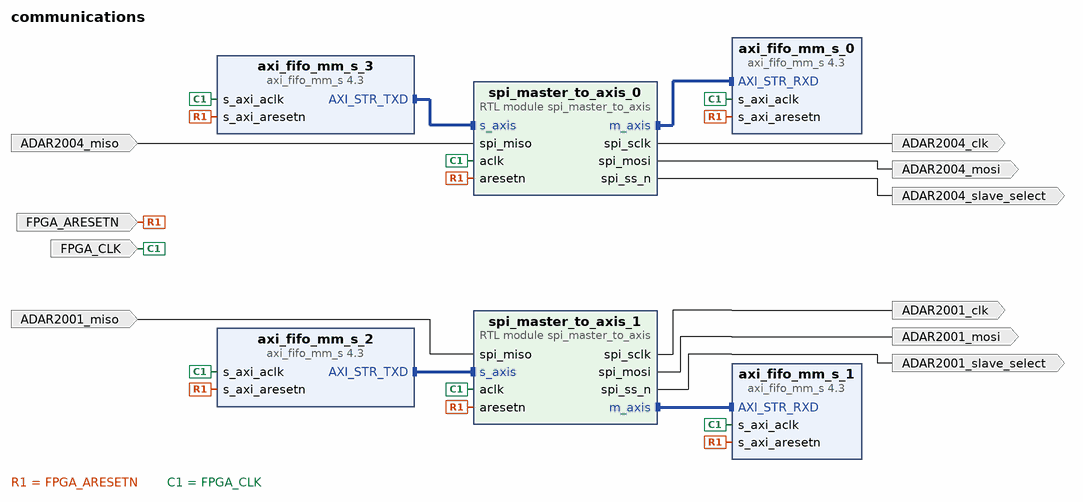
[diagram p0: block diagram of the top level]
# Vivado block design communications, xc7a35tcpg236-1, Vivado 2026.1
create_bd_design communications

create_bd_port -dir I -type clk FPGA_CLK
set_property -dict {CONFIG.FREQ_HZ 100000000} [get_bd_ports FPGA_CLK]
create_bd_port -dir I FPGA_ARESETN
create_bd_port -dir O ADAR2004_clk
create_bd_port -dir O ADAR2004_slave_select
create_bd_port -dir O ADAR2004_mosi
create_bd_port -dir I ADAR2004_miso
create_bd_port -dir O ADAR2001_clk
create_bd_port -dir I ADAR2001_miso
create_bd_port -dir O ADAR2001_mosi
create_bd_port -dir O ADAR2001_slave_select

create_bd_cell -type module -reference spi_master_to_axis spi_master_to_axis_0
create_bd_cell -type module -reference spi_master_to_axis spi_master_to_axis_1
create_bd_cell -type ip -vlnv xilinx.com:ip:axi_fifo_mm_s:4.3 axi_fifo_mm_s_0
create_bd_cell -type ip -vlnv xilinx.com:ip:axi_fifo_mm_s:4.3 axi_fifo_mm_s_1
create_bd_cell -type ip -vlnv xilinx.com:ip:axi_fifo_mm_s:4.3 axi_fifo_mm_s_2
create_bd_cell -type ip -vlnv xilinx.com:ip:axi_fifo_mm_s:4.3 axi_fifo_mm_s_3

# ---- connections ----

connect_bd_intf_net [get_bd_intf_pins axi_fifo_mm_s_2/AXI_STR_TXD] [get_bd_intf_pins spi_master_to_axis_1/s_axis]
connect_bd_intf_net [get_bd_intf_pins axi_fifo_mm_s_3/AXI_STR_TXD] [get_bd_intf_pins spi_master_to_axis_0/s_axis]
connect_bd_intf_net [get_bd_intf_pins spi_master_to_axis_0/m_axis] [get_bd_intf_pins axi_fifo_mm_s_0/AXI_STR_RXD]
connect_bd_intf_net [get_bd_intf_pins spi_master_to_axis_1/m_axis] [get_bd_intf_pins axi_fifo_mm_s_1/AXI_STR_RXD]
connect_bd_net [get_bd_ports ADAR2001_miso] [get_bd_pins spi_master_to_axis_1/spi_miso]
connect_bd_net [get_bd_ports ADAR2004_miso] [get_bd_pins spi_master_to_axis_0/spi_miso]
connect_bd_net [get_bd_ports FPGA_ARESETN] \
  [get_bd_pins spi_master_to_axis_0/aresetn] [get_bd_pins spi_master_to_axis_1/aresetn] \
  [get_bd_pins axi_fifo_mm_s_1/s_axi_aresetn] [get_bd_pins axi_fifo_mm_s_2/s_axi_aresetn] \
  [get_bd_pins axi_fifo_mm_s_0/s_axi_aresetn] [get_bd_pins axi_fifo_mm_s_3/s_axi_aresetn]
connect_bd_net [get_bd_ports FPGA_CLK] \
  [get_bd_pins spi_master_to_axis_0/aclk] [get_bd_pins spi_master_to_axis_1/aclk] [get_bd_pins axi_fifo_mm_s_3/s_axi_aclk] \
  [get_bd_pins axi_fifo_mm_s_0/s_axi_aclk] [get_bd_pins axi_fifo_mm_s_1/s_axi_aclk] [get_bd_pins axi_fifo_mm_s_2/s_axi_aclk]
connect_bd_net [get_bd_pins spi_master_to_axis_0/spi_mosi] [get_bd_ports ADAR2004_mosi]
connect_bd_net [get_bd_pins spi_master_to_axis_0/spi_sclk] [get_bd_ports ADAR2004_clk]
connect_bd_net [get_bd_pins spi_master_to_axis_0/spi_ss_n] [get_bd_ports ADAR2004_slave_select]
connect_bd_net [get_bd_pins spi_master_to_axis_1/spi_mosi] [get_bd_ports ADAR2001_mosi]
connect_bd_net [get_bd_pins spi_master_to_axis_1/spi_sclk] [get_bd_ports ADAR2001_clk]
connect_bd_net [get_bd_pins spi_master_to_axis_1/spi_ss_n] [get_bd_ports ADAR2001_slave_select]

validate_bd_design
save_bd_design
